# Altium schematic sheet parameter_sets.SchDoc
size 254 x 203 mm
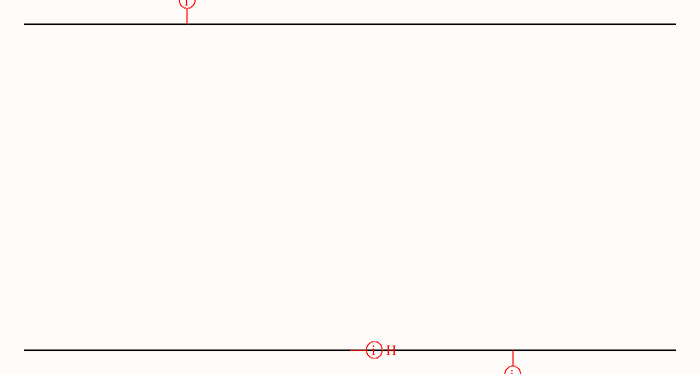
[diagram p0: parameter_sets.SchDoc]

## Layout directives
net class HT: (no net found under the mark)
net class H: (no net found under the mark)
Comment: nothing: (no net found under the mark)